# Altium schematic sheet Plytka_srodkowa_ESP_SD.SchDoc
size A4; SheetNumber: 1; SheetTotal: 3
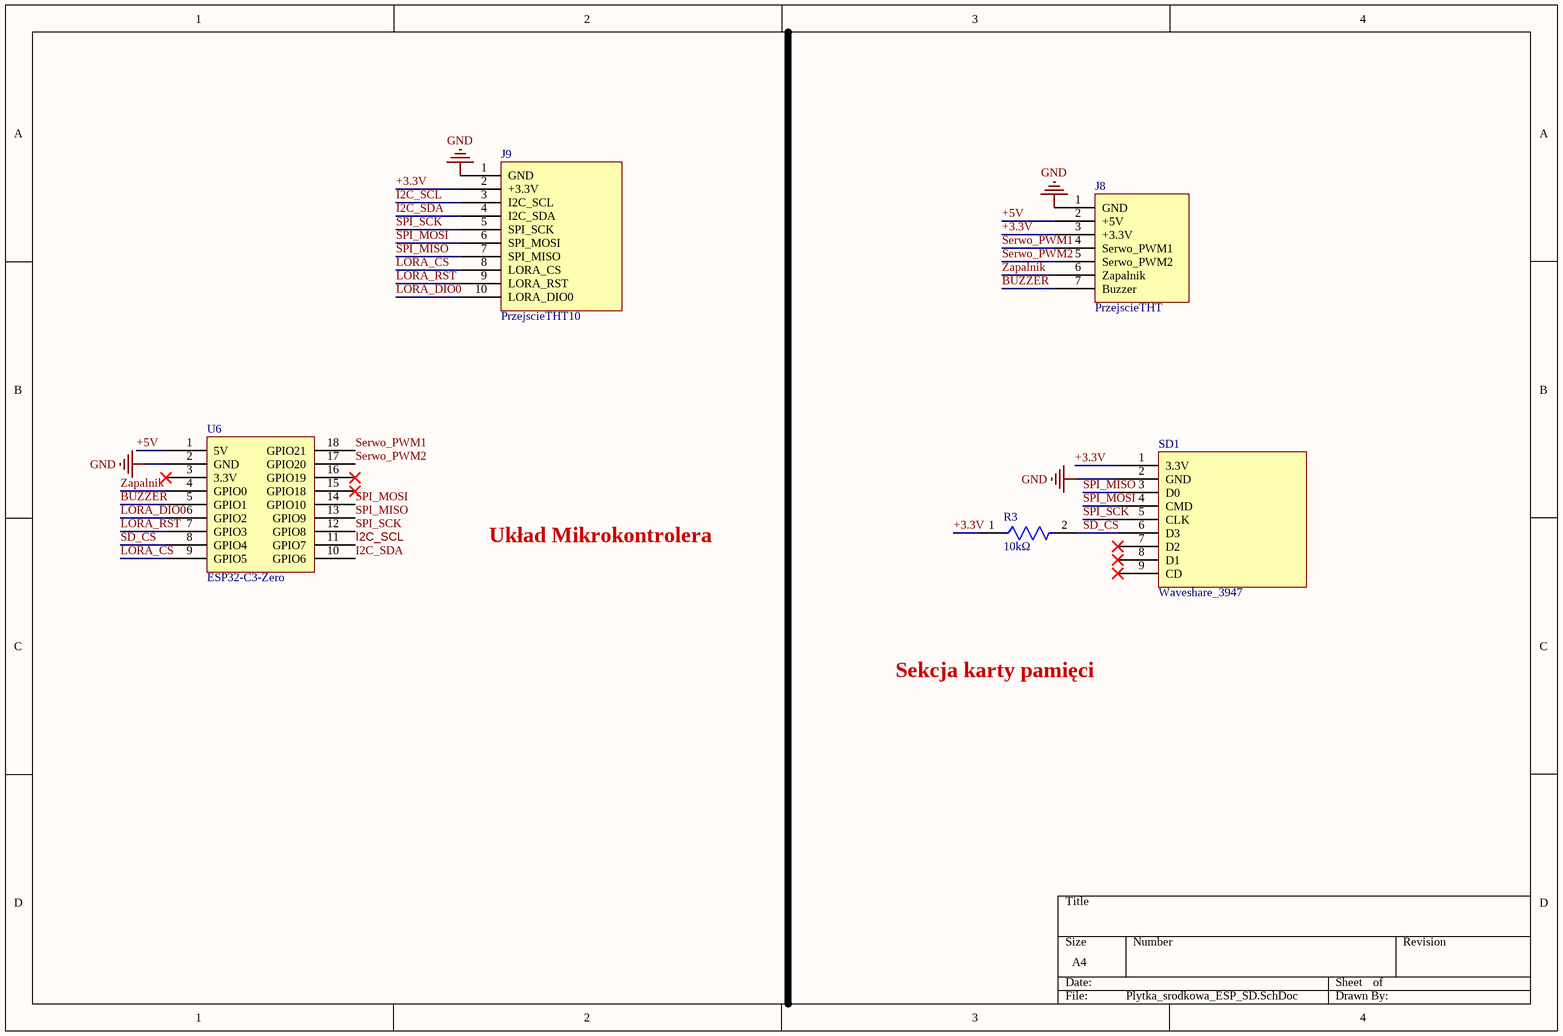
[diagram p0: Plytka_srodkowa_ESP_SD.SchDoc]

## Parts
J8  PrzejscieTHT  [PrzejscieTHT]
J9  PrzejscieTHT10  [PrzejscieTHT10]
R3  10kΩ  [FP-CRGCQ0805-IPC_C]
SD1  Waveshare_3947  [Waveshare_3947]
U6  ESP32-C3-Zero  [ESP32-C3-Zero]

## Nets
GND: J8.1(GND) J9.1(GND) SD1.2(GND) U6.2(GND)
+3.3V: J8.3(+3.3V) J9.2(+3.3V) R3.1 SD1.1(3.3V)
+5V: J8.2(+5V) U6.1(5V)
BUZZER: J8.7(Buzzer) U6.5(GPIO1)
I2C_SCL: J9.3(I2C_SCL) U6.11(GPIO7)
I2C_SDA: J9.4(I2C_SDA) U6.10(GPIO6)
LORA_CS: J9.8(LORA_CS) U6.9(GPIO5)
LORA_DIO0: J9.10(LORA_DIO0) U6.6(GPIO2)
LORA_RST: J9.9(LORA_RST) U6.7(GPIO3)
SD_CS: R3.2 SD1.6(D3) U6.8(GPIO4)
Serwo_PWM1: J8.4(Serwo_PWM1) U6.18(GPIO21)
Serwo_PWM2: J8.5(Serwo_PWM2) U6.17(GPIO20)
SPI_MISO: J9.7(SPI_MISO) SD1.3(D0) U6.13(GPIO9)
SPI_MOSI: J9.6(SPI_MOSI) SD1.4(CMD) U6.14(GPIO10)
SPI_SCK: J9.5(SPI_SCK) SD1.5(CLK) U6.12(GPIO8)
Zapalnik: J8.6(Zapalnik) U6.4(GPIO0)

Not connected (* = marked no-connect by the designer): SD1 7(D2)* 8(D1)* 9(CD)*; U6 3(3.3V)* 15(GPIO18)* 16(GPIO19)*

## Notes on the sheet
- Układ Mikrokontrolera
- Sekcja karty pamięci

## Library data of the parts
R3 = CMP-03211-002989-1: CRGCQ 0805 10K 5%; Manufacturer Part Number: CRGCQ0805J10K; Manufacturer: TE Connectivity; Voltage Rating: 150V; Temperature Coefficient: ±100ppm/°C; Power Rating: 0.125W; Tolerance: 0.05; Automotive Grade: Grade 914; Height: 0.65mm; Lead Free: Yes; Temperature Range High: +155°C; Composition: Thick Film; Temperature Range Low: -55°C; Resistance: 10KΩ; Ambient Temperature Range High: +70°C; Temperature: -55°C to +155°C; Package: CRGCQ0805; Device Class L2: Resistors; RoHS: TRUE; ComponentLink2URL: https://www.te.com/commerce/DocumentDelivery/DDEController?Action=showdoc&DocId=Data+Sheet%7F1773204-3%7F1%7Fpdf%7FEnglish%7FENG_DS_1773204-3_1.pdf%7F4-2176341-923; Series: CRGCQ; Device Class L1: Passive Components; Ipc Land Pattern Name: RESC200125X55; Value: 10KΩ; ComponentLink2Description: Datasheet; Category: Res; Digikey Description: CRGCQ 0805 10K 5%; Mouser Description: Res Thick Film 0805 10K Ohm 5% 0.125W(1/8W) ±100ppm/C Pad SMD Automotive T/R; Automotive: Yes; Octopart: https://octopart.com/crgcq0805j10k-te+connectivity-91018201; Device Class L3: Chip SMD Resistors